# Altium schematic sheet Voltage Regs.SchDoc
size A4; SheetNumber: 3; SheetTotal: 3; SPICEModelCacheINGCNGJP: <root> / <DocumentId>INGCNGJP</DocumentId> / </root>
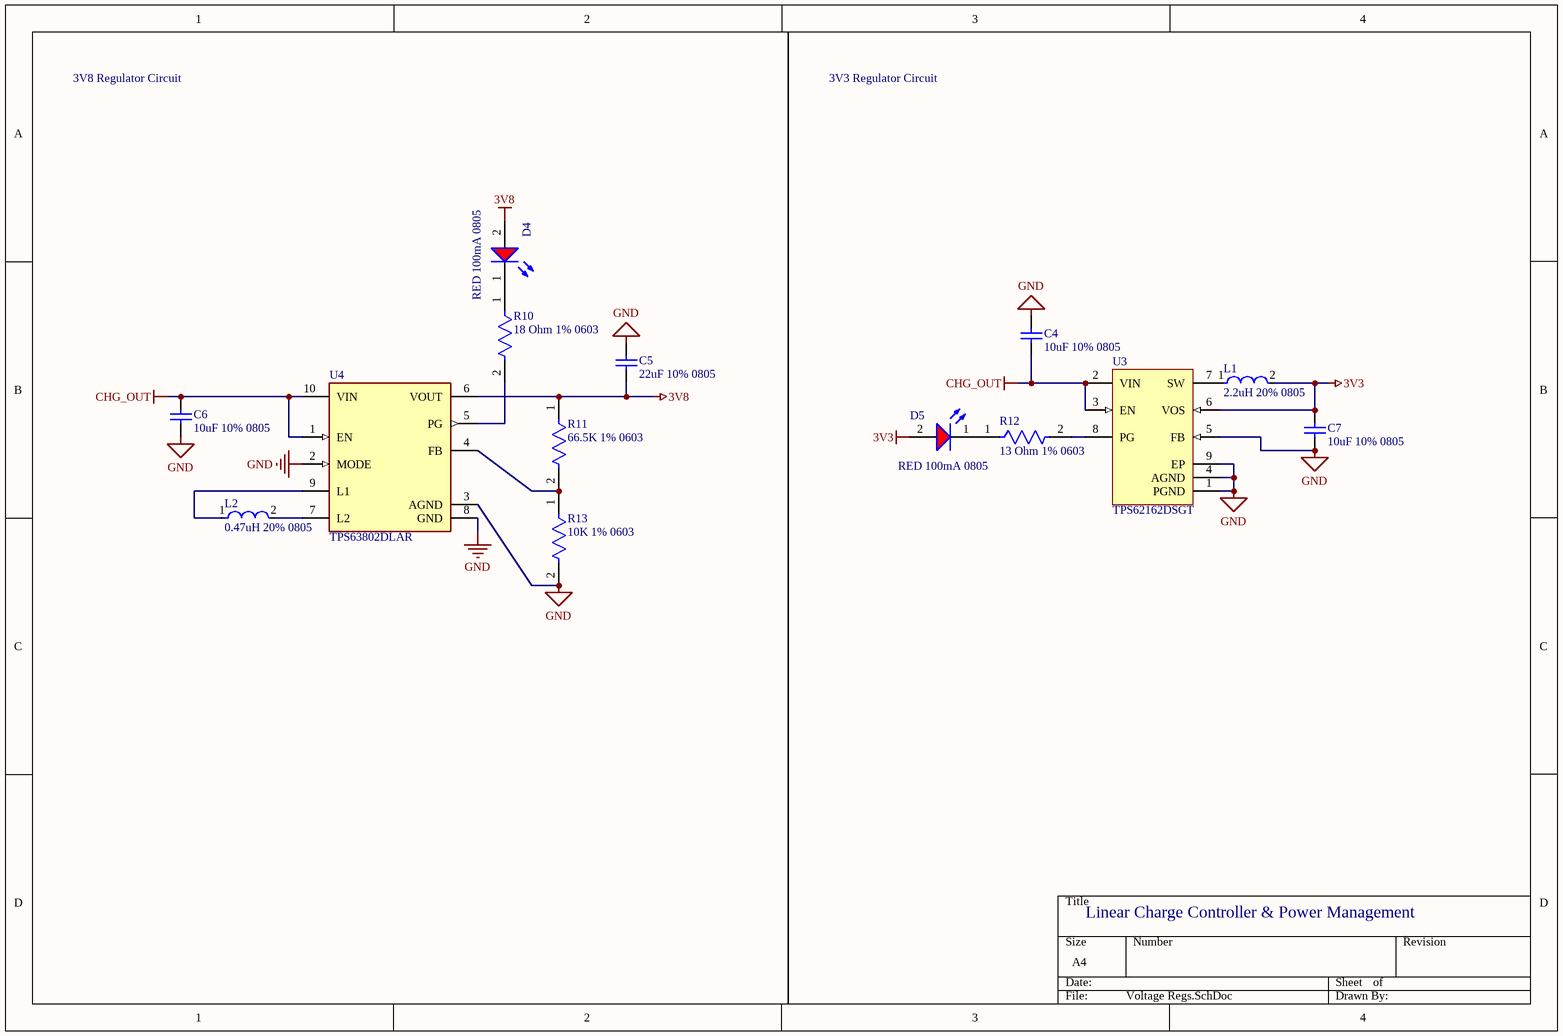
[diagram p0: Voltage Regs.SchDoc]

## Parts
C4  10uF 10% 0805  [CAPC2013X145X50ML20T25]
C5  22uF 10% 0805  [CAPC0805(2012)145_L]
C6  10uF 10% 0805  [CAPC2013X145X50ML20T25]
C7  10uF 10% 0805  [CAPC2013X145X50ML20T25]
D4  RED 100mA 0805  [WL-SMCW_0805_150080xx75000]
D5  RED 100mA 0805  [WL-SMCW_0805_150080xx75000]
L1  2.2uH 20% 0805  [FP-DFE2016CKA-IPC_A]
L2  0.47uH 20% 0805  [FP-LQM21PN_CH-w1_5-IPC_A]
R10  18 Ohm 1% 0603  [FP-AC0603-MFG]
R11  66.5K 1% 0603  [FP-AC0603-MFG]
R12  13 Ohm 1% 0603  [FP-AC0603-MFG]
R13  10K 1% 0603  [FP-AC0603-MFG]
U3  TPS62162DSGT  [DSG0008A_V]
U4  TPS63802DLAR  [FP-DLA0010A-MFG]

## Nets
3V3: C7.2 D5.2(A) L1.2 U3.6(VOS)
3V8: C5.1 D4.2(A) R11.1 U4.6(VOUT)
CHG_OUT: C4.1 C6.2 U3.2(VIN) U3.3(EN) U4.1(EN) U4.10(VIN)
GND: C4.2 C5.2 C6.1 C7.1 R13.2 U3.1(PGND) U3.4(AGND) U3.5(FB) U3.9(EP) U4.2(MODE) U4.3(AGND) U4.8(GND)
NetD4_1: D4.1(K) R10.1
NetD5_1: D5.1(K) R12.1
NetL1_1: L1.1 U3.7(SW)
NetL2_1: L2.1 U4.9(L1)
NetL2_2: L2.2 U4.7(L2)
NetR10_2: R10.2 U4.5(PG)
NetR11_2: R11.2 R13.1 U4.4(FB)
NetR12_2: R12.2 U3.8(PG)

## Notes on the sheet
- 3V8 Regulator Circuit
- 3V3 Regulator Circuit
- Linear Charge Controller & Power Management

## Library data of the parts
C4 C6 C7 = CMP-2007-01044-1: Manufacturer: Kemet; Part Number: C0805C106K8RACTU
C5 = CMP-1036-04938-1: CAP 22uF 6.3V ±10% 0805 (2012 Metric) Thickness 1.45mm SMD; Tolerance: Â±10%; Case-EIA: 0805; Case-Metric: 2012; Technology: SMT; Rated Voltage: 6.3 V; Max Thickness: 1.45 mm; Value: 22uF
D4 D5 = CMP-1426-00011-4: LED Uni-Color Red 630nm 2-Pin Chip 0805(2012Metric) T/R; Manufacturer Lifecycle Status: ACTIVE; Luminous Intensity: 150mcd; Viewing Angle: 140°; Dominant Wavelength: 625nm; Forward Voltage: 2V; Max Reverse Voltage (DC): 5V; Lens Style: Clear, Rectangular; Test Current: 20mA; Max Junction Temperature (Tj): 95°C; Power Dissipation: 72mW; YEOL: 1 = Estimated lifetime > 10 years; Lifecycle Status: Production; Color: Red; Height: 700µm; RoHS: Compliant; Width: 1.25mm; Min Operating Temperature: -40°C; Wavelength: 625nm; Mount: Surface Mount; Max Operating Temperature: 85°C; Forward Current: 100mA; Peak Wavelength: 630nm; Case Code (Imperial): 0805; Manufacturer Package Identifier: 0805 (2012 metric); Length: 2mm; REACH SVHC: Unknown; Case/Package: 0805; Packaging: Tape and Reel; Case Code (Metric): 2012
L1 = CMP-06042-016665-1: Chip Inductors Wirewound Metal Alloy Shielding 0806 Package 2.2uH 20% 1MHz
L2 = CMP-06042-016314-1: Multilayer Type Inductor for Power Lines, 2012, 0.47μH, 20%, 0.138Ω, 1.8A; RoHS Compliant: Yes
R10 = CMP-03412-005942-2: RES 18Ω 1.00% 0.1W 0603; Resistance: 18R; Max Power Dissipation: 100mW; Temperature Coefficient: 100ppm/°C; Height: 0.022inch; Max Operating Temperature: 155°C; Number of Terminations: 2; Length: 0.063inch; Tolerance: 1%; Depth: 0.8mm; Width: 0.031inch; Packaging: Tape and Reel; Min Operating Temperature: -55°C; Series: AC; Resistor Type: Thick Film; Case/Package: 0603; Features: Moisture Resistant; RoHS Compliant: Yes; Military Standard: Not
R11 = CMP-03412-000604-2: RES 66.5KΩ 1.00% 0.1W 0603; Resistance: 66.5kR; Temperature Coefficient: 100ppm/°C; Voltage Rating: 50V; Max Power Dissipation: 100mW; Case Code (Imperial): 0603; Height: 0.45mm; Resistor Type: Thick Film; Tolerance: 1%; Min Operating Temperature: -55°C; Max Operating Temperature: 155°C; Features: Moisture Resistant; Length: 1.6mm; Width: 0.8mm; Weight: 7.1E-05oz; Number of Terminations: 2; Case Code (Metric): 1608; Packaging: Tape and Reel; Series: AC; Case/Package: 0603; Termination: SMD/SMT; Ratings: AEC-Q200; RoHS Compliant: Yes; Power Rating: 100mW
R12 = CMP-03412-014777-2: RES 13Ω 1.00% 0.1W 0603; Resistance: 13R; Temperature Coefficient: 100ppm/°C; Max Power Dissipation: 100mW; Width: 0.031inch; Tolerance: 1%; Number of Terminations: 2; Max Operating Temperature: 155°C; RoHS Compliant: Yes; Case/Package: 0603; Series: AC; Length: 0.063inch; Packaging: Tape and Reel; Features: Moisture Resistant; Resistor Type: Thick Film; Min Operating Temperature: -55°C; Height: 0.022inch
R13 = CMP-03412-038553-1: RES 10kΩ 1.00% 0.2W 0603
U3 = CMP-0323-00319-3: Buck Step Down Regulator with 3 to 17 V Input and 3.3 V Output, -40 to 85 degC, 8-Pin WSON (DSG), Green (RoHS & no Sb/Br); Manufacturer: Texas Instruments; Synchronous Rectification: TRUE; Iq(Typ)(mA): 0.017; Switch Current Limit(Typ)(A): 1.8; Regulated Outputs(#): 1; Duty Cycle(Max)(%): 100; SubFamily: Step-Down Regulator; Preset Vout(V): 3.3; Rating: Catalog; Vin(Max)(V): 17; Vin(Min)(V): 3; ComponentLink2Description: Package Specification; PackageVersion: revB, Oct-2010; DatasheetVersion: SLVSAM2A; ComponentLink1Description: Datasheet; PackageDescription: 8-Pin Plastic Small Outline No-Lead, 2 x 2 x 0.8 mm Body, 0.5 mm Pitch, Exposed Pad; ComponentLink2URL: http://www.ti.com/litv/pdf/mpds308a; Code_JEDEC: MO-229; PartNumber: TPS62162DSGT; ComponentLink3URL: Samples URL:http://www.ti.com/product/tps54611#samples; Mounting Technology: Surface Mount; Eco-Plan: Green (RoHS & no Sb/Br); Vout(Min)(V): 3.3; PackageReference: DSG0008A; Topology: Buck; ComponentLink1URL: http://www.ti.com/general/docs/lit/getliterature.tsp?genericPartNumber=TPS62162&fileType=pdf; Vout(Max)(V): 3.3; Iout(Max)(A): 1; ComponentLink3Description: URL Link1
U4 = CMP-04918-000005-1: IC POWER MANAGEMENT; Manufacturer: Texas Instruments; Nominal Supply Current: 11uA; Max Junction Temp: +125°C; Max Supply Voltage: 5.5V; Switching Topology: Buck-Boost; Min Supply Voltage: 1.3V; Output Current: 2A; Output Voltage: 1.8-5.2V; Number Of Outputs: 1; Switching Frequency: 1.4/1.6/2.1MHz; Standoff Height: 0mm; Max Duty Cycle: 100%; Output Type: AdjustableProgrammable; Manufacturer Part Number: TPS63802DLAR; ComponentLink2URL: https://www.ti.com/lit/ds/symlink/tps63802.pdf; Digikey Description: IC POWER MANAGEMENT; Octopart: https://octopart.com/tps63802dlar-texas+instruments-97359678; Height: 1mm; Temperature: -40°C to +125°C; Device Class L3: Voltage Regulators - Switching; Lead Free: Yes; Category: IC; Mouser Description: 2-A, high-efficient, 11-µA quiescent current buck-boost converter in QFN/DFN package 10-VSON-HR -40 to 125; ComponentLink2Description: Datasheet; Temperature Range Low: -40°C; Temperature Range High: +125°C; Automotive: No; Device Class L2: Power Management ICs; RoHS: TRUE; Device Class L1: Integrated Circuits (ICs); Package: DLA0010A